# Altium schematic sheet Controller_Sheet.SchDoc (part 1 of 2)
size 420 x 297 mm; DocumentNumber: 3; SheetNumber: 3; SheetTotal: 14
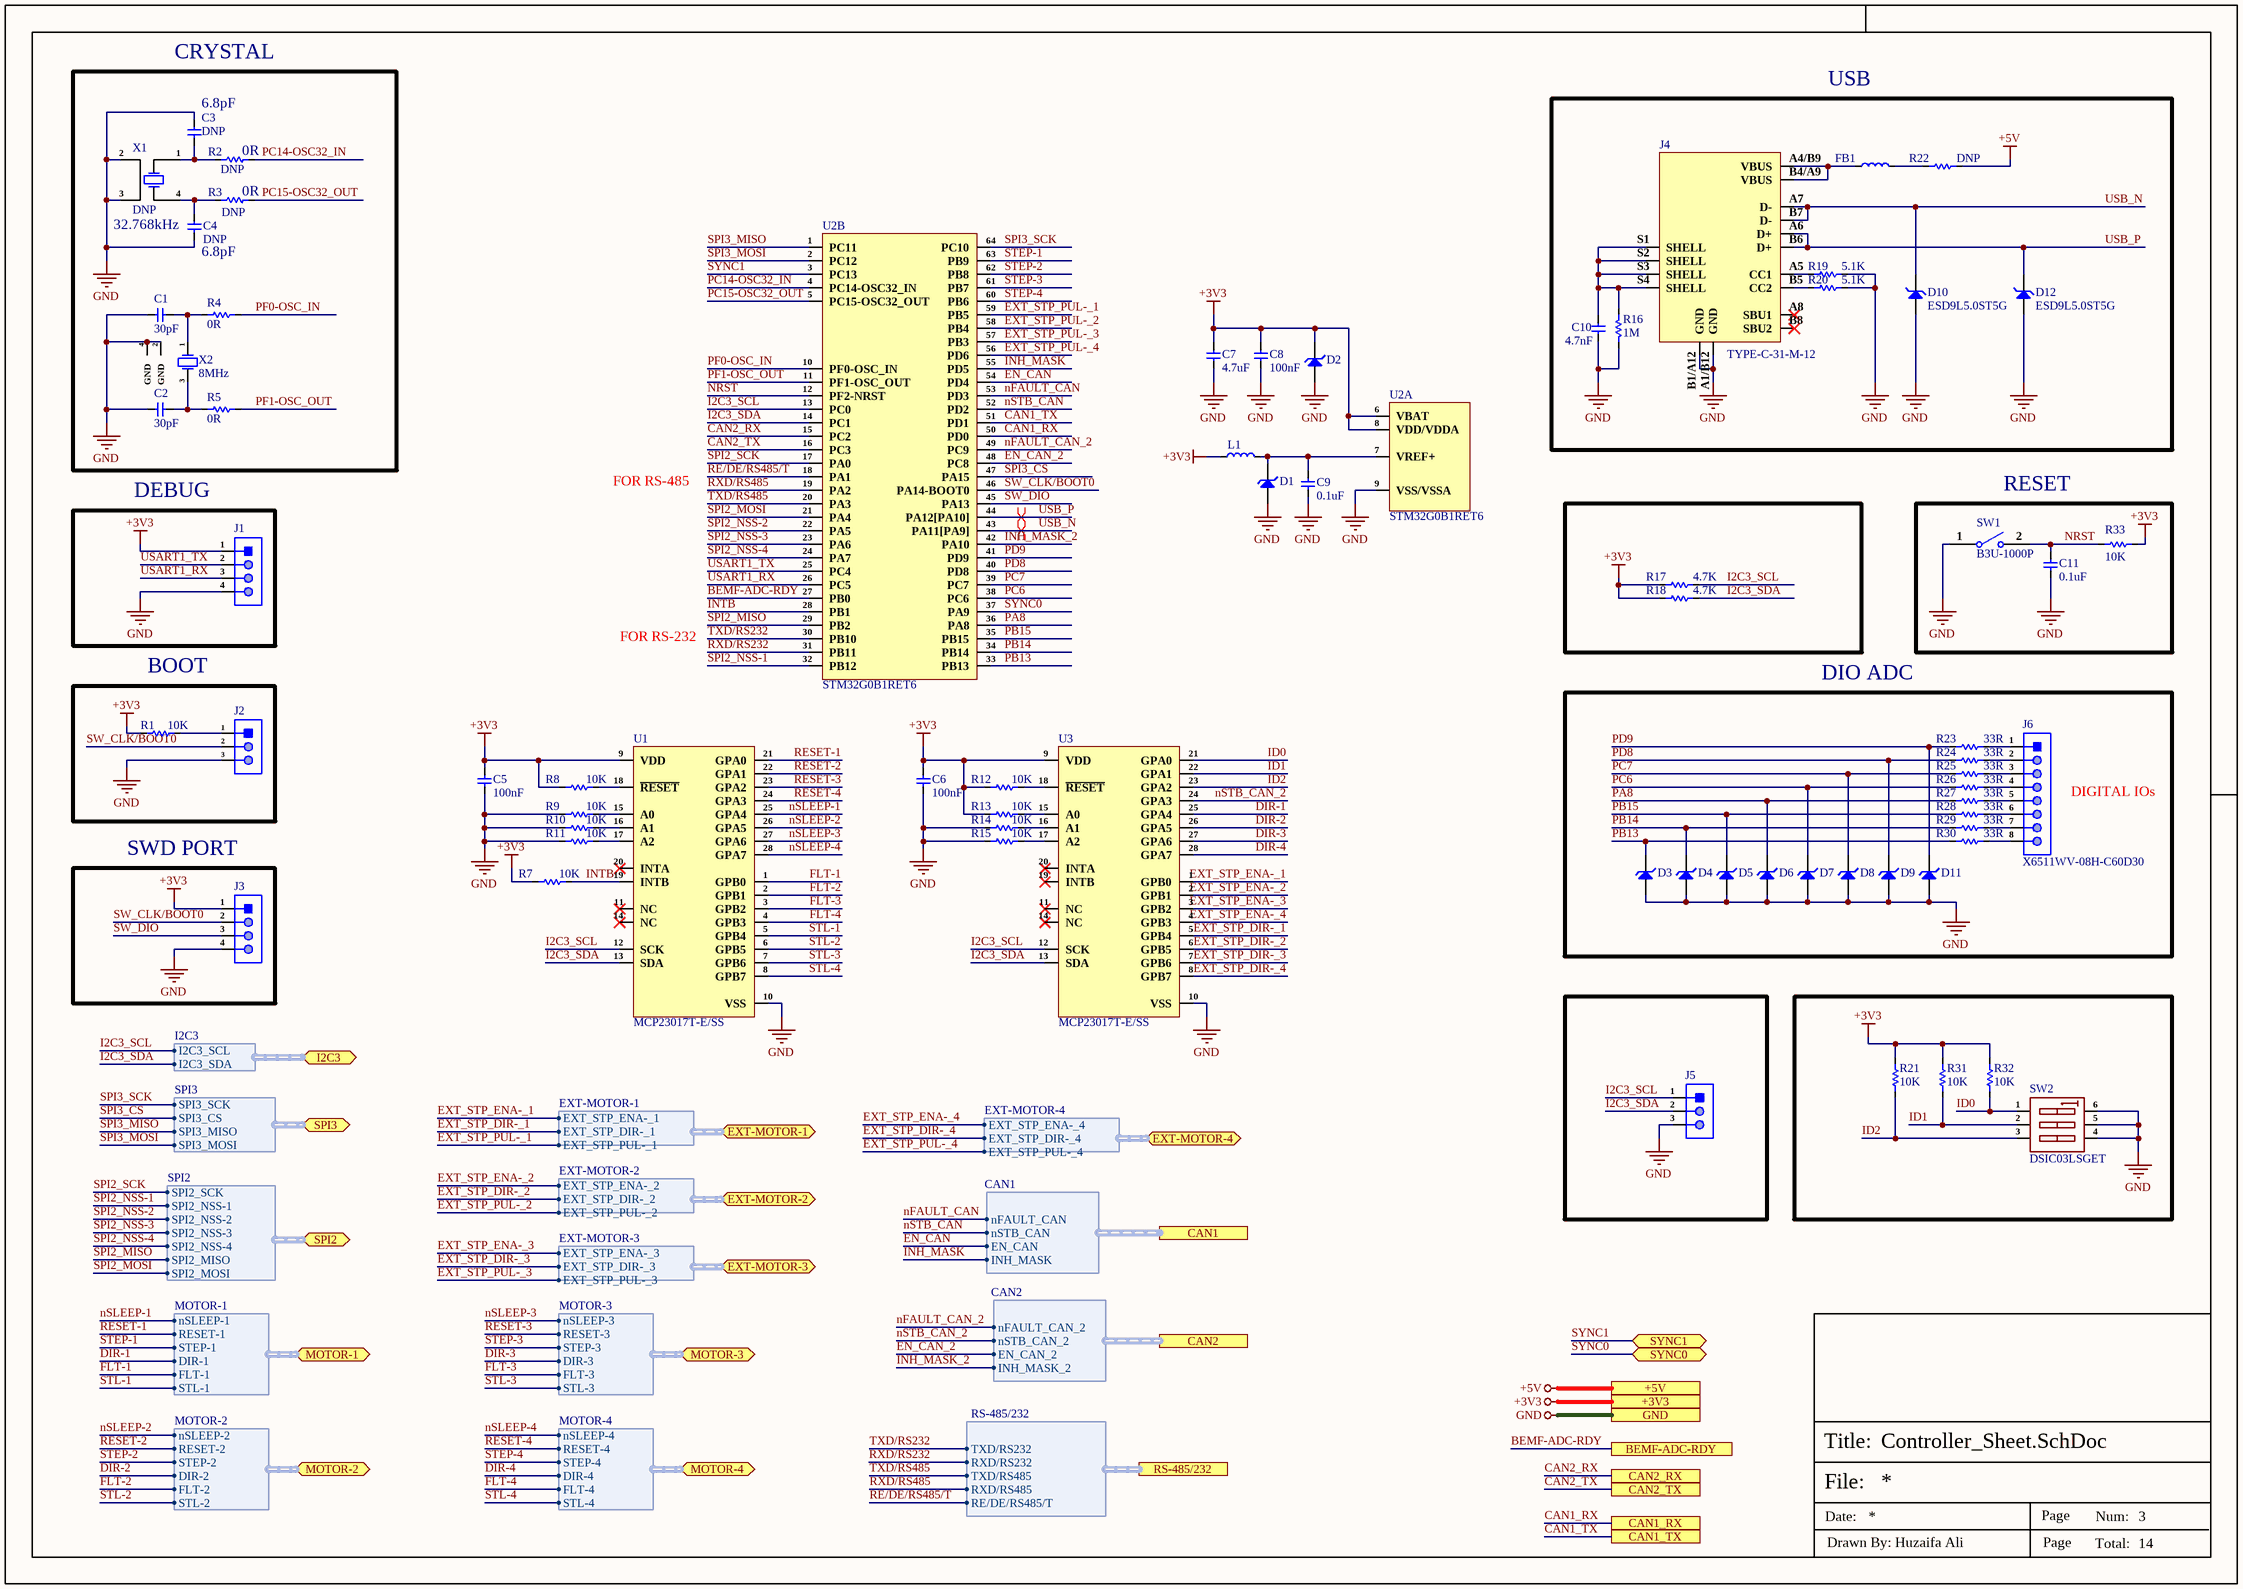
[diagram p0: Controller_Sheet.SchDoc]

## Parts
C1  30pF  [Cap-0402]
C2  30pF  [Cap-0402]
C3  DNP  [Cap-0402]
C4  DNP  [Cap-0402]
C5  100nF  [cap-0402]
C6  100nF  [cap-0402]
C7  4.7uF  [Cap-0402]
C8  100nF  [cap-0402]
C9  0.1uF  [Cap-0402]
C10  4.7nF  [Cap-0603]
C11  0.1uF  [Cap-0402]
D1  SD03  [SOD-323]  (value not drawn)
D2  SD03  [SOD-323]  (value not drawn)
D3  MM3Z3V3  [SOD-323]  (value not drawn)
D4  MM3Z3V3  [SOD-323]  (value not drawn)
D5  MM3Z3V3  [SOD-323]  (value not drawn)
D6  MM3Z3V3  [SOD-323]  (value not drawn)
D7  MM3Z3V3  [SOD-323]  (value not drawn)
D8  MM3Z3V3  [SOD-323]  (value not drawn)
D9  MM3Z3V3  [SOD-323]  (value not drawn)
D10  ESD9L5.0ST5G  [SOD-923.]
D11  MM3Z3V3  [SOD-323]  (value not drawn)
D12  ESD9L5.0ST5G  [SOD-923.]
FB1  BLM18PG221SN1D  [IND-0603 (1608 Metric)]  (value not drawn)
J1  X6511WV-04H-C60D30  [HDR1X4_]  (value not drawn)
J2  68000-103HLF  [HDR1X3_]  (value not drawn)
J3  X6511WV-04H-C60D30  [HDR1X4_]  (value not drawn)
J4  TYPE-C-31-M-12  [TYPE-C-31-M-12_]
J5  B3B-XH-A(LF)(SN)  [B3B-XH-A(LF)(SN)_]  (value not drawn)
J6  X6511WV-08H-C60D30  [HDR 1x8 TH male]
L1  BLM15AG601SN1D  [IND-0402]  (value not drawn)
R1  10K  [Res-0402]
R2  DNP  [Res-0603]
R3  DNP  [Res-0603]
R4  0R  [Res-0603]
R5  0R  [Res-0603]
R7  10K  [Res-0402]
R8  10K  [Res-0402]
R9  10K  [Res-0402]
R10  10K  [Res-0402]
R11  10K  [Res-0402]
R12  10K  [Res-0402]
R13  10K  [Res-0402]
R14  10K  [Res-0402]
R15  10K  [Res-0402]
R16  1M  [Res-0402]
R17  4.7K  [Res-0402]
R18  4.7K  [Res-0402]
R19  5.1K  [Res-0402]
R20  5.1K  [Res-0402]
R21  10K  [Res-0402]
R22  DNP  [Res-0402]
R23  33R  [Res-0402]
R24  33R  [Res-0402]
R25  33R  [Res-0402]
R26  33R  [Res-0402]
R27  33R  [Res-0402]
R28  33R  [Res-0402]
R29  33R  [Res-0402]
R30  33R  [Res-0402]
R31  10K  [Res-0402]
R32  10K  [Res-0402]
R33  10K  [Res-0402]
SW1  B3U-1000P  [B3U-1000P]
SW2  DSIC03LSGET  [DSIC03LSGET]
U1  MCP23017T-E/SS  [SSOP-28-208mil]
U2  STM32G0B1RET6  [LQFP-64(10x10)]  (parts A,B of 2)
U3  MCP23017T-E/SS  [SSOP-28-208mil]
X1  DNP  [MC-306]
X2  8MHz  [5TJ480000XYLBC_]

## Blocks framed on the sheet
CRYSTAL: C1-C4 R2-R5 X1 X2
USB: C10 D10 D12 FB1 J4 R16 R19 R20 R22
DEBUG: J1
RESET: C11 R33 SW1
BOOT: J2 R1
DIO ADC: D3-D9 D11 J6 R23-R30
SWD PORT: J3

## Ports
+3V3 (see Top-Sheet[3A], CAN_Sheet[5D], EtherCAT_Sheet[5D], Power_Sheet[5D], RS485_RS232_Sheet[2D], Stepper_Driver_Sheet[5D]), +5V (see Top-Sheet[3A], CAN_Sheet[5D], Ext_Stepper_Driver_Sheet[5D], Power_Sheet[5D]), BEMF-ADC-RDY (see Top-Sheet[3B], Stepper_Driver_Sheet[3D]), CAN1 (harness CAN1, see Top-Sheet[4A], CAN_Sheet[3D]), CAN1_RX (see Top-Sheet[4A], CAN_Sheet[2D]), CAN1_TX (see Top-Sheet[4A], CAN_Sheet[2D]), CAN2 (harness CAN2, see Top-Sheet[4A], CAN_Sheet[3D]), CAN2_RX (see Top-Sheet[4A], CAN_Sheet[2D]), CAN2_TX (see Top-Sheet[4A], CAN_Sheet[2D]), EXT-MOTOR-1 (bidir, harness EXT-MOTOR-1, see Top-Sheet[4B], Ext_Stepper_Driver_Sheet[2D]), EXT-MOTOR-2 (bidir, harness EXT-MOTOR-2, see Top-Sheet[4B], Ext_Stepper_Driver_Sheet[2D]), EXT-MOTOR-3 (bidir, harness EXT-MOTOR-3, see Top-Sheet[4B], Ext_Stepper_Driver_Sheet[4D]), EXT-MOTOR-4 (bidir, harness EXT-MOTOR-4, see Top-Sheet[4B], Ext_Stepper_Driver_Sheet[4D]), GND (see Top-Sheet[3A], CAN_Sheet[5D], EtherCAT_Sheet[5D], Ext_Stepper_Driver_Sheet[5D], Power_Sheet[5D], RS485_RS232_Sheet[2D], Stepper_Driver_Sheet[5D]), I2C3 (bidir, harness I2C3, see Top-Sheet[3B], Stepper_Driver_Sheet[3D]), MOTOR-1 (bidir, harness MOTOR-1, see Top-Sheet[3B], Stepper_Driver_Sheet[4D]), MOTOR-2 (bidir, harness MOTOR-2, see Top-Sheet[3B], Stepper_Driver_Sheet[4D]), MOTOR-3 (bidir, harness MOTOR-3, see Top-Sheet[3B], Stepper_Driver_Sheet[5D]), MOTOR-4 (bidir, harness MOTOR-4, see Top-Sheet[3B], Stepper_Driver_Sheet[5D]), RS-485/232 (harness RS-485/232, see Top-Sheet[3B], RS485_RS232_Sheet[4D]), SPI2 (bidir, harness SPI2, see Top-Sheet[3B], Stepper_Driver_Sheet[3D]), SPI3 (bidir, harness SPI3, see Top-Sheet[4B], EtherCAT_Sheet[1D]), SYNC0 (bidir, see Top-Sheet[4B], EtherCAT_Sheet[5D]), SYNC1 (bidir, see Top-Sheet[4B], EtherCAT_Sheet[5D])

## Harnesses
RS-485/232: TXD/RS232, RXD/RS232, TXD/RS485, RXD/RS485, RE/DE/RS485/T
CAN1: nFAULT_CAN, nSTB_CAN, EN_CAN, INH_MASK
CAN2: nFAULT_CAN_2, nSTB_CAN_2, EN_CAN_2, INH_MASK_2
SPI3: SPI3_SCK, SPI3_CS, SPI3_MISO, SPI3_MOSI
SPI2: SPI2_NSS-2, SPI2_NSS-3, SPI2_NSS-4, SPI2_SCK, SPI2_MOSI, SPI2_MISO, SPI2_NSS-1
I2C3: I2C3_SCL, I2C3_SDA
MOTOR-1: nSLEEP-1, RESET-1, STEP-1, DIR-1, FLT-1, STL-1
MOTOR-2: nSLEEP-2, RESET-2, STEP-2, DIR-2, FLT-2, STL-2
MOTOR-3: nSLEEP-3, RESET-3, STEP-3, DIR-3, FLT-3, STL-3
MOTOR-4: nSLEEP-4, RESET-4, STEP-4, DIR-4, FLT-4, STL-4
EXT-MOTOR-1: EXT_STP_ENA-_1, EXT_STP_DIR-_1, EXT_STP_PUL-_1
EXT-MOTOR-2: EXT_STP_ENA-_2, EXT_STP_DIR-_2, EXT_STP_PUL-_2
EXT-MOTOR-3: EXT_STP_ENA-_3, EXT_STP_DIR-_3, EXT_STP_PUL-_3
EXT-MOTOR-4: EXT_STP_ENA-_4, EXT_STP_DIR-_4, EXT_STP_PUL-_4

## Nets
+3V3: C5.2 C6.2 C7.2 C8.2 D2.1(K) J1.1 J3.1 L1.1 R1.2 R7.2 R8.2 R12.2 R13.2 R17.2 R18.2 R21.2 R31.2 R32.2 R33.2 U1.9(VDD) U2.6(VBAT) U2.8(VDD/VDDA) U3.9(VDD) ; port +3V3
+5V: R22.2 ; port +5V
GND: C1.1 C2.1 C3.1 C4.2 C5.1 C6.1 C7.1 C8.1 C9.1 C10.1 C11.1 D1.2(A) D2.2(A) D3.2(A) D4.2(A) D5.2(A) D6.2(A) D7.2(A) D8.2(A) D9.2(A) D10.2(A) D11.2(A) D12.2(A) J1.4 J2.3 J3.4 J4.A1/B12(GND) J4.B1/A12(GND) J5.3 R9.2 R10.2 R11.2 R14.2 R15.2 R16.2 R19.2 R20.2 SW1.1 SW2.4(B3) SW2.5(B2) SW2.6(B1) U1.10(VSS) U2.9(VSS/VSSA) U3.10(VSS) X1.2 X1.3 X2.2(GND) X2.4(GND) ; port GND
BEMF-ADC-RDY: U2.27(PB0) ; port BEMF-ADC-RDY
CAN1_RX: U2.50(PD0) ; port CAN1_RX
CAN1_TX: U2.51(PD1) ; port CAN1_TX
CAN2_RX: U2.15(PC2) ; port CAN2_RX
CAN2_TX: U2.16(PC3) ; port CAN2_TX
DIR-1: U3.25(GPA4) ; port MOTOR-1.DIR-1
DIR-2: U3.26(GPA5) ; port MOTOR-2.DIR-2
DIR-3: U3.27(GPA6) ; port MOTOR-3.DIR-3
DIR-4: U3.28(GPA7) ; port MOTOR-4.DIR-4
EN_CAN: U2.54(PD4) ; port CAN1.EN_CAN
EN_CAN_2: U2.48(PC8) ; port CAN2.EN_CAN_2
EXT_STP_DIR-_1: U3.5(GPB4) ; port EXT-MOTOR-1.EXT_STP_DIR-_1
EXT_STP_DIR-_2: U3.6(GPB5) ; port EXT-MOTOR-2.EXT_STP_DIR-_2
EXT_STP_DIR-_3: U3.7(GPB6) ; port EXT-MOTOR-3.EXT_STP_DIR-_3
EXT_STP_DIR-_4: U3.8(GPB7) ; port EXT-MOTOR-4.EXT_STP_DIR-_4
EXT_STP_ENA-_1: U3.1(GPB0) ; port EXT-MOTOR-1.EXT_STP_ENA-_1
EXT_STP_ENA-_2: U3.2(GPB1) ; port EXT-MOTOR-2.EXT_STP_ENA-_2
EXT_STP_ENA-_3: U3.3(GPB2) ; port EXT-MOTOR-3.EXT_STP_ENA-_3
EXT_STP_ENA-_4: U3.4(GPB3) ; port EXT-MOTOR-4.EXT_STP_ENA-_4
EXT_STP_PUL-_1: U2.59(PB5) ; port EXT-MOTOR-1.EXT_STP_PUL-_1
EXT_STP_PUL-_2: U2.58(PB4) ; port EXT-MOTOR-2.EXT_STP_PUL-_2
EXT_STP_PUL-_3: U2.57(PB3) ; port EXT-MOTOR-3.EXT_STP_PUL-_3
EXT_STP_PUL-_4: U2.56(PD6) ; port EXT-MOTOR-4.EXT_STP_PUL-_4
FLT-1: U1.1(GPB0) ; port MOTOR-1.FLT-1
FLT-2: U1.2(GPB1) ; port MOTOR-2.FLT-2
FLT-3: U1.3(GPB2) ; port MOTOR-3.FLT-3
FLT-4: U1.4(GPB3) ; port MOTOR-4.FLT-4
I2C3_SCL: J5.1 R17.1 U1.12(SCK) U2.13(PC0) U3.12(SCK) ; port I2C3.I2C3_SCL
I2C3_SDA: J5.2 R18.1 U1.13(SDA) U2.14(PC1) U3.13(SDA) ; port I2C3.I2C3_SDA
ID0: R32.1 SW2.1(A1) U3.21(GPA0)
ID1: R31.1 SW2.2(A2) U3.22(GPA1)
ID2: R21.1 SW2.3(A3) U3.23(GPA2)
INH_MASK: U2.55(PD5) ; port CAN1.INH_MASK
INH_MASK_2: U2.42(PA10) ; port CAN2.INH_MASK_2
INTB: R7.1 U1.19(INTB) U2.28(PB1)
nFAULT_CAN: U2.53(PD3) ; port CAN1.nFAULT_CAN
nFAULT_CAN_2: U2.49(PC9) ; port CAN2.nFAULT_CAN_2
NRST: C11.2 R33.1 SW1.2 U2.12(PF2-NRST)
nSLEEP-1: U1.25(GPA4) ; port MOTOR-1.nSLEEP-1
nSLEEP-2: U1.26(GPA5) ; port MOTOR-2.nSLEEP-2
nSLEEP-3: U1.27(GPA6) ; port MOTOR-3.nSLEEP-3
nSLEEP-4: U1.28(GPA7) ; port MOTOR-4.nSLEEP-4
nSTB_CAN: U2.52(PD2) ; port CAN1.nSTB_CAN
nSTB_CAN_2: U3.24(GPA3) ; port CAN2.nSTB_CAN_2
PA8: D6.1(K) R27.1 U2.36(PA8)
PB13: D3.1(K) R30.1 U2.33(PB13)
PB14: D4.1(K) R29.1 U2.34(PB14)
PB15: D5.1(K) R28.1 U2.35(PB15)
PC6: D7.1(K) R26.1 U2.38(PC6)
PC7: D8.1(K) R25.1 U2.39(PC7)
PC14-OSC32_IN: R2.2 U2.4(PC14-OSC32_IN)
PC15-OSC32_OUT: R3.2 U2.5(PC15-OSC32_OUT)
PD8: D9.1(K) R24.1 U2.40(PD8)
PD9: D11.1(K) R23.1 U2.41(PD9)
PF0-OSC_IN: R4.2 U2.10(PF0-OSC_IN)
PF1-OSC_OUT: R5.2 U2.11(PF1-OSC_OUT)
RE/DE/RS485/T: U2.18(PA1) ; port RS-485/232.RE/DE/RS485/T
RESET-1: U1.21(GPA0) ; port MOTOR-1.RESET-1
RESET-2: U1.22(GPA1) ; port MOTOR-2.RESET-2
RESET-3: U1.23(GPA2) ; port MOTOR-3.RESET-3
RESET-4: U1.24(GPA3) ; port MOTOR-4.RESET-4
RXD/RS232: U2.31(PB11) ; port RS-485/232.RXD/RS232
RXD/RS485: U2.19(PA2) ; port RS-485/232.RXD/RS485
SPI2_MISO: U2.29(PB2) ; port SPI2.SPI2_MISO
SPI2_MOSI: U2.21(PA4) ; port SPI2.SPI2_MOSI
SPI2_NSS-1: U2.32(PB12) ; port SPI2.SPI2_NSS-1
SPI2_NSS-2: U2.22(PA5) ; port SPI2.SPI2_NSS-2
SPI2_NSS-3: U2.23(PA6) ; port SPI2.SPI2_NSS-3
SPI2_NSS-4: U2.24(PA7) ; port SPI2.SPI2_NSS-4
SPI2_SCK: U2.17(PA0) ; port SPI2.SPI2_SCK
SPI3_CS: U2.47(PA15) ; port SPI3.SPI3_CS
SPI3_MISO: U2.1(PC11) ; port SPI3.SPI3_MISO
SPI3_MOSI: U2.2(PC12) ; port SPI3.SPI3_MOSI
SPI3_SCK: U2.64(PC10) ; port SPI3.SPI3_SCK
STEP-1: U2.63(PB9) ; port MOTOR-1.STEP-1
STEP-2: U2.62(PB8) ; port MOTOR-2.STEP-2
STEP-3: U2.61(PB7) ; port MOTOR-3.STEP-3
STEP-4: U2.60(PB6) ; port MOTOR-4.STEP-4
STL-1: U1.5(GPB4) ; port MOTOR-1.STL-1
STL-2: U1.6(GPB5) ; port MOTOR-2.STL-2
STL-3: U1.7(GPB6) ; port MOTOR-3.STL-3
STL-4: U1.8(GPB7) ; port MOTOR-4.STL-4
SW_CLK/BOOT0: J2.2 J3.2 U2.46(PA14-BOOT0)
SW_DIO: J3.3 U2.45(PA13)
SYNC0: U2.37(PA9) ; port SYNC0
SYNC1: U2.3(PC13) ; port SYNC1
TXD/RS232: U2.30(PB10) ; port RS-485/232.TXD/RS232
TXD/RS485: U2.20(PA3) ; port RS-485/232.TXD/RS485
USART1_RX: J1.3 U2.26(PC5)
USART1_TX: J1.2 U2.25(PC4)
USB_N: D10.1(K) J4.A7(D-) J4.B7(D-) U2.43(PA11[PA9])
USB_P: D12.1(K) J4.A6(D+) J4.B6(D+) U2.44(PA12[PA10])
NetC1_2: C1.2 R4.1 X2.1(OSC1)
NetC2_2: C2.2 R5.1 X2.3(OSC2)
NetC3_2: C3.2 R2.1 X1.1(OSC1)
NetC4_1: C4.1 R3.1 X1.4(OSC2)
NetC9_2: C9.2 D1.1(K) L1.2 U2.7(VREF+)
NetC10_2: C10.2 J4.S1(SHELL) J4.S2(SHELL) J4.S3(SHELL) J4.S4(SHELL) R16.1
NetFB1_1: FB1.1 J4.A4/B9(VBUS) J4.B4/A9(VBUS)
NetFB1_2: FB1.2 R22.1
NetJ2_1: J2.1 R1.1
NetJ4_A5: J4.A5(CC1) R19.1
NetJ4_B5: J4.B5(CC2) R20.1
NetJ6_1: J6.1 R23.2
NetJ6_2: J6.2 R24.2
NetJ6_3: J6.3 R25.2
NetJ6_4: J6.4 R26.2
NetJ6_5: J6.5 R27.2
NetJ6_6: J6.6 R28.2
NetJ6_7: J6.7 R29.2
NetJ6_8: J6.8 R30.2
NetR8_1: R8.1 U1.18(~{RESET})
NetR9_1: R9.1 U1.15(A0)
NetR10_1: R10.1 U1.16(A1)
NetR11_1: R11.1 U1.17(A2)
NetR12_1: R12.1 U3.18(~{RESET})
NetR13_1: R13.1 U3.15(A0)
NetR14_1: R14.1 U3.16(A1)
NetR15_1: R15.1 U3.17(A2)

Not connected (* = marked no-connect by the designer): J4 A8(SBU1)* B8(SBU2)*; U1 11(NC)* 14(NC)* 20(INTA)*; U3 11(NC)* 14(NC)* 19(INTB)* 20(INTA)*

## Layout directives
differential pair; net class USB_PROGRAM; differential pair class USB_PROGRAM_LINES; rule Impedance Constraint [Min = 85.00    Max = 90.00    ]; rule Matched Net Lengths [Tolerance = 50mil]: USB_N, USB_P

## Notes on the sheet
- (near C3) 6.8pF
- (near R2) 0R
- 32.768kHz
- (near C4) 6.8pF
- (near R3) 0R
- FOR RS-485
- FOR RS-232
- (near J6) DIGITAL IOs
- DIGITAL IOs REQUESTED BY CLIENT
- File:
- Title:
- Date:
- Page
- Num:
- Total:
- Drawn By: Huzaifa Ali